# Altium schematic sheet Driver_4.SchDoc
size A; SheetNumber: 7; SheetTotal: 7
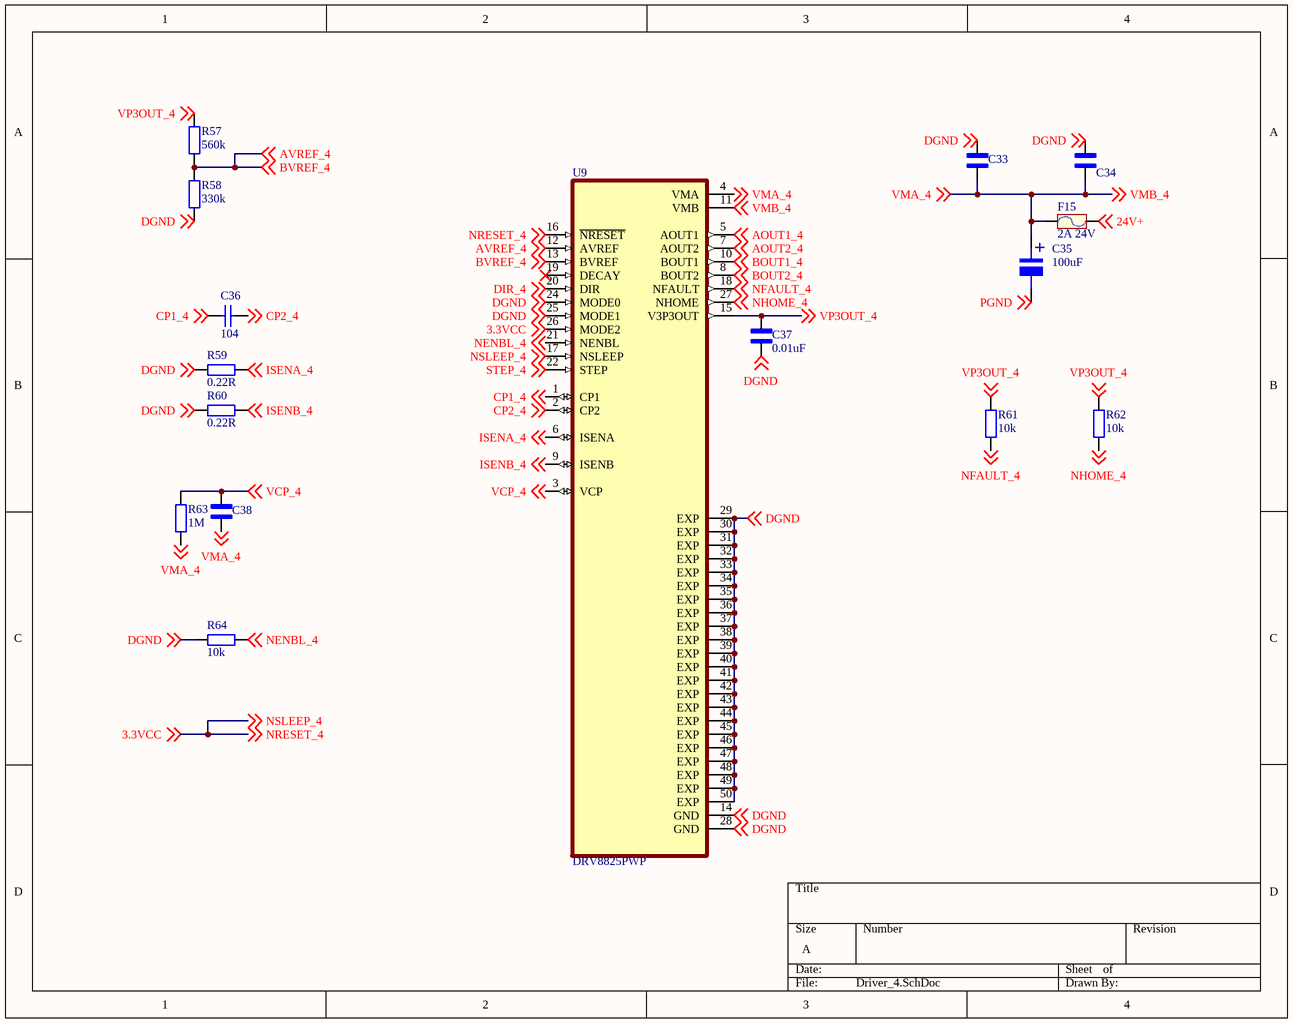
[diagram p0: Driver_4.SchDoc]

## Parts
C33  C0402C104K3RACTU  [CAPC1005X55N]  (value not drawn)
C34  C0402C104K3RACTU  [CAPC1005X55N]  (value not drawn)
C35  100uF  [tu nhom 6.3 (d)]
C36  104  [tu 1206]
C37  0.01uF  [CAPC1608X90N]
C38  C0402C104K3RACTU  [CAPC1005X55N]  (value not drawn)
F15  2A 24V  [Cau chi tu phuc hoi 2A 24V SMD1812]
R57  560k  [Tro SMD 0805]
R58  330k  [Tro SMD 0805]
R59  0.22R  [tro smd 0805]
R60  0.22R  [tro smd 0805]
R61  10k  [tro smd 0805]
R62  10k  [tro smd 0805]
R63  1M  [tro smd 0805]
R64  10k  [tro smd 0805]
U9  DRV8825PWP  [IC_TPS61196PWPRQ1]

## Nets
3.3VCC: U9.16(~{NRESET}) U9.17(NSLEEP) U9.26(MODE2) ; off-sheet 3.3VCC, off-sheet NRESET_4, off-sheet NSLEEP_4  [also labelled NRESET_4, NSLEEP_4]
24V+: F15.2 ; off-sheet 24V+
AOUT1_4: U9.5(AOUT1) ; off-sheet AOUT1_4
AOUT2_4: U9.7(AOUT2) ; off-sheet AOUT2_4
AVREF_4: R57.1 R58.2 U9.12(AVREF) U9.13(BVREF) ; off-sheet AVREF_4, off-sheet BVREF_4  [also labelled BVREF_4]
BOUT1_4: U9.10(BOUT1) ; off-sheet BOUT1_4
BOUT2_4: U9.8(BOUT2) ; off-sheet BOUT2_4
CP1_4: C36.1 U9.1(CP1) ; off-sheet CP1_4
CP2_4: C36.2 U9.2(CP2) ; off-sheet CP2_4
DGND: C33.2 C34.2 C37.1 R58.1 R59.1 R60.1 R64.1 U9.14(GND) U9.24(MODE0) U9.25(MODE1) U9.28(GND) U9.29(EXP) U9.30(EXP) U9.31(EXP) U9.32(EXP) U9.33(EXP) U9.34(EXP) U9.35(EXP) U9.36(EXP) U9.37(EXP) U9.38(EXP) U9.39(EXP) U9.40(EXP) U9.41(EXP) U9.42(EXP) U9.43(EXP) U9.44(EXP) U9.45(EXP) U9.46(EXP) U9.47(EXP) U9.48(EXP) U9.49(EXP) U9.50(EXP) ; off-sheet DGND
DIR_4: U9.20(DIR) ; off-sheet DIR_4
ISENA_4: R59.2 U9.6(ISENA) ; off-sheet ISENA_4
ISENB_4: R60.2 U9.9(ISENB) ; off-sheet ISENB_4
NENBL_4: R64.2 U9.21(NENBL) ; off-sheet NENBL_4
NFAULT_4: R61.1 U9.18(NFAULT) ; off-sheet NFAULT_4
NHOME_4: R62.1 U9.27(NHOME) ; off-sheet NHOME_4
PGND: C35.2 ; off-sheet PGND
STEP_4: U9.22(STEP) ; off-sheet STEP_4
VCP_4: C38.2 R63.2 U9.3(VCP) ; off-sheet VCP_4
VMA_4: C33.1 C34.1 C35.1 C38.1 F15.1 R63.1 U9.4(VMA) U9.11(VMB) ; off-sheet VMA_4, off-sheet VMB_4  [also labelled VMB_4]
VP3OUT_4: C37.2 R57.2 R61.2 R62.2 U9.15(V3P3OUT) ; off-sheet VP3OUT_4

Not connected (* = marked no-connect by the designer): U9 19(DECAY)*

## Notes on the sheet
- (in symbol Tu Nhom 100uF 16V) +

## Library data of the parts
C33 C34 C38 = C0402C104K3RACTU: MF: {'manufacturer': u'KEMET'}; Package: None; Price: None; Value: *; MP: C0402C104K3RACTU; Availability: Unavailable
C35 = Tu Nhom 100uF 16V: Dán; Don_Vi: Con; So_Chan: 2; Ten_Linh_Kien: Tụ Nhôm 100uF 16V 6.3x5.4MM; Ma_Hang: MH002219; Chung_Loai: Dán; Kieu_Chan: *
C36 = Tu 1206 104 50V 20%: Dán; Don_Vi: Con; So_Chan: 2; Ten_Linh_Kien: Tụ 1206 104-0.1uF 20% 50V; Ma_Hang: MH004544; Chung_Loai: Dán; Kieu_Chan: *
C37 = GCE188R72A103KA01D: 0603 0.01 uF 100 V Â±10% Tolerance X7R Multilayer Ceramic Capacitor; MF: Murata; Package: 1608 Murata; Check_prices: https://www.snapeda.com/parts/GCE188R72A103KA01D/Murata%20Electronics%20North%20America/view-part/1764845/?ref=eda; Value: *; Price: None; Purchase-URL: https://pricing.snapeda.com/search/part/GCE188R72A103KA01D/?ref=eda; MP: GCE188R72A103KA01D; Availability: Good; SnapEDA_Link: https://www.snapeda.com/parts/GCE188R72A103KA01D/Murata%20Electronics%20North%20America/view-part/1764845/?ref=snap
F15 = Cau chi tu phuc hoi 2A 24V SMD1812: 2A 24V SMD1812; Ma_Hang: MH010033; Ten: Cầu Chì Tự Phục Hồi 2A 24V SMD1812
R57 = Tro 0805 5% 560k: Dán; Don_Vi: Con; Ma_Hang: MH005342; Ten_Linh_Kien: Trở 0805 5% 560k; So_Chan: 2; Chung_Loai: Dán; Kieu_Chan: *
R58 = Tro 0805 5% 330k: Dán; Don_Vi: Con; So_Chan: 2; Ten_Linh_Kien: Trở 0805 5% 330K; Ma_Hang: MH005336; Chung_Loai: Dán; Kieu_Chan: *
R59 R60 = Tro 0805 1% 0.22R: Dán; Don_Vi: Con; So_Chan: 2; Ten_Linh_Kien: Trở 0805 1% 0.22R; Ma_Hang: MH005466; Chung_Loai: Dán; Kieu_Chan: *
R61 R62 R64 = Tro 0805 1% 10k: Dán; Don_Vi: Con; So_Chan: 2; Ten_Linh_Kien: Trở 0805 1% 10k; Ma_Hang: MH005473; Chung_Loai: Dán; Kieu_Chan: *
R63 = Tro 0805 1% 1M: Dán; Don_Vi: Con; So_Chan: 2; Ten_Linh_Kien: Trở 0805 1% 1M; Ma_Hang: MH005469; Chung_Loai: Dán; Kieu_Chan: *
U9 = DRV8825PWP: <a href="https://snapeda.com/parts/DRV8825PWP/Texas%20Instruments/view-part/?ref=eda">Buy Part</a>; Package: None; Availability: Unavailable; Value: *; MP: DRV8825PWP; Price: None